# EAGLE schematic Chronos_DaughterBoard (EAGLE 9.7.0)
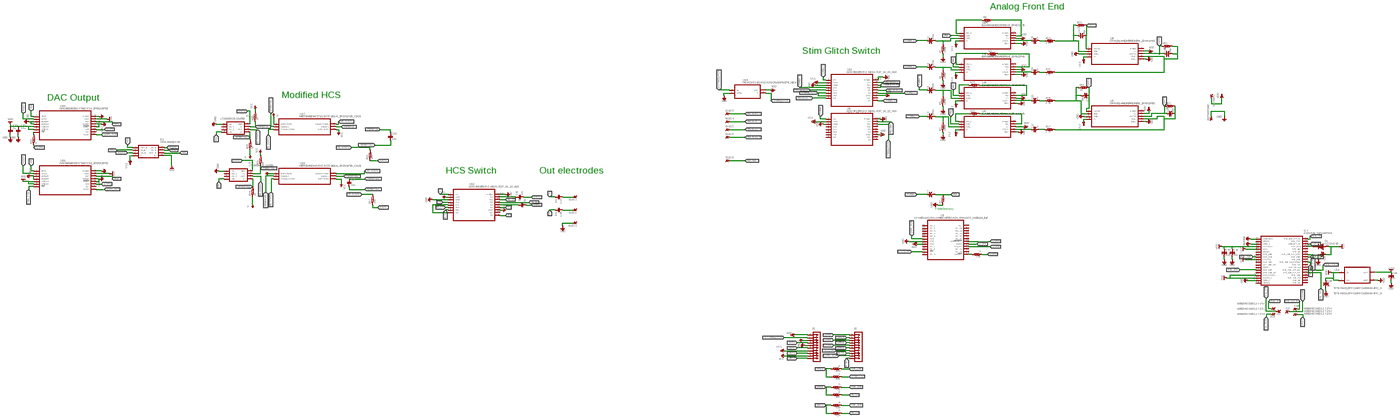
[diagram p0: schematic, sheet 1, overview]
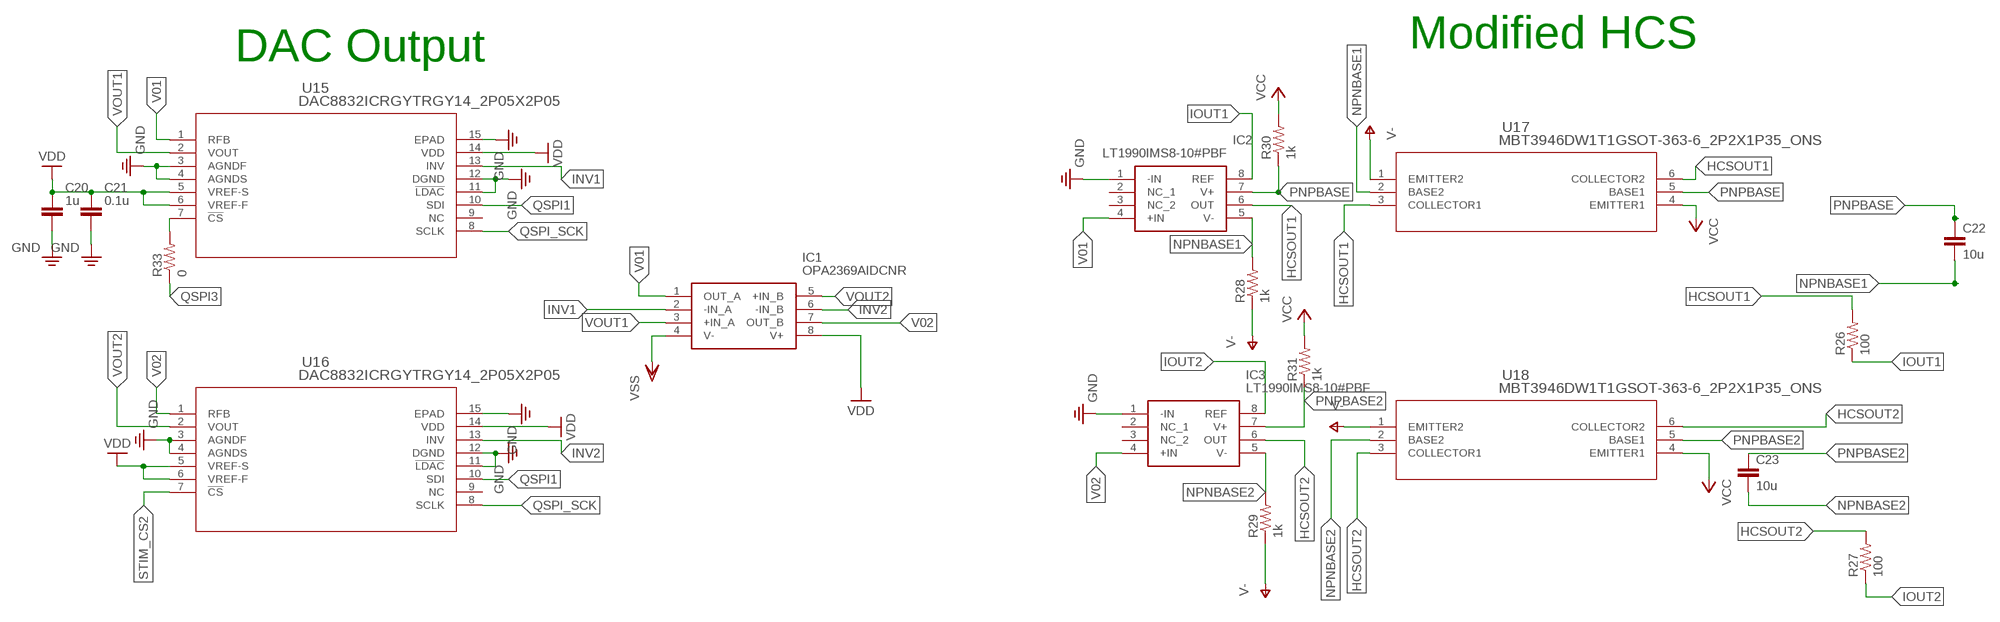
[diagram p1: schematic, sheet 1, part 1 of 4]
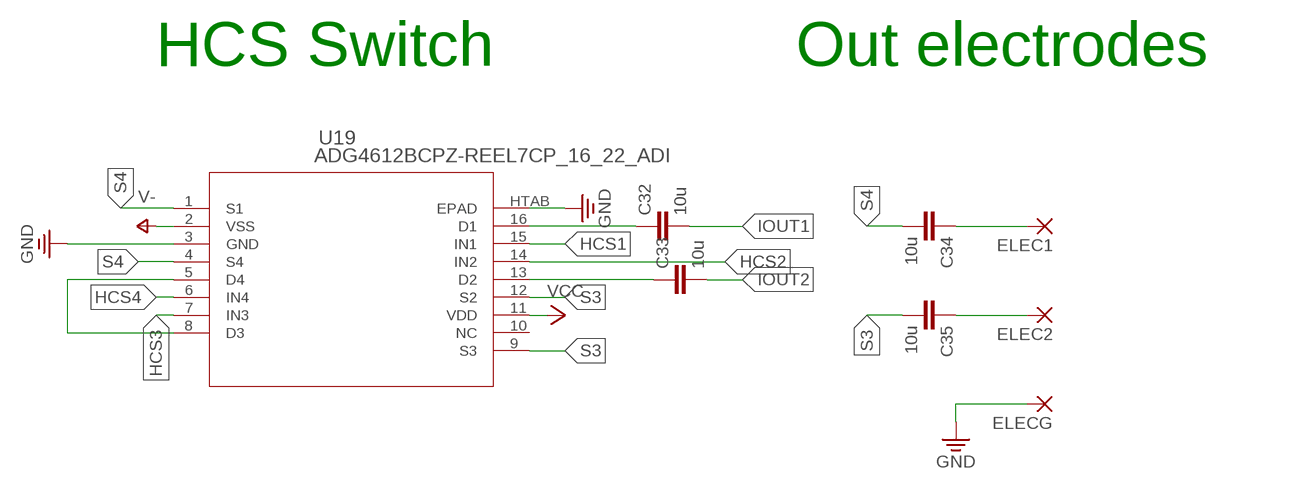
[diagram p2: schematic, sheet 1, part 2 of 4]
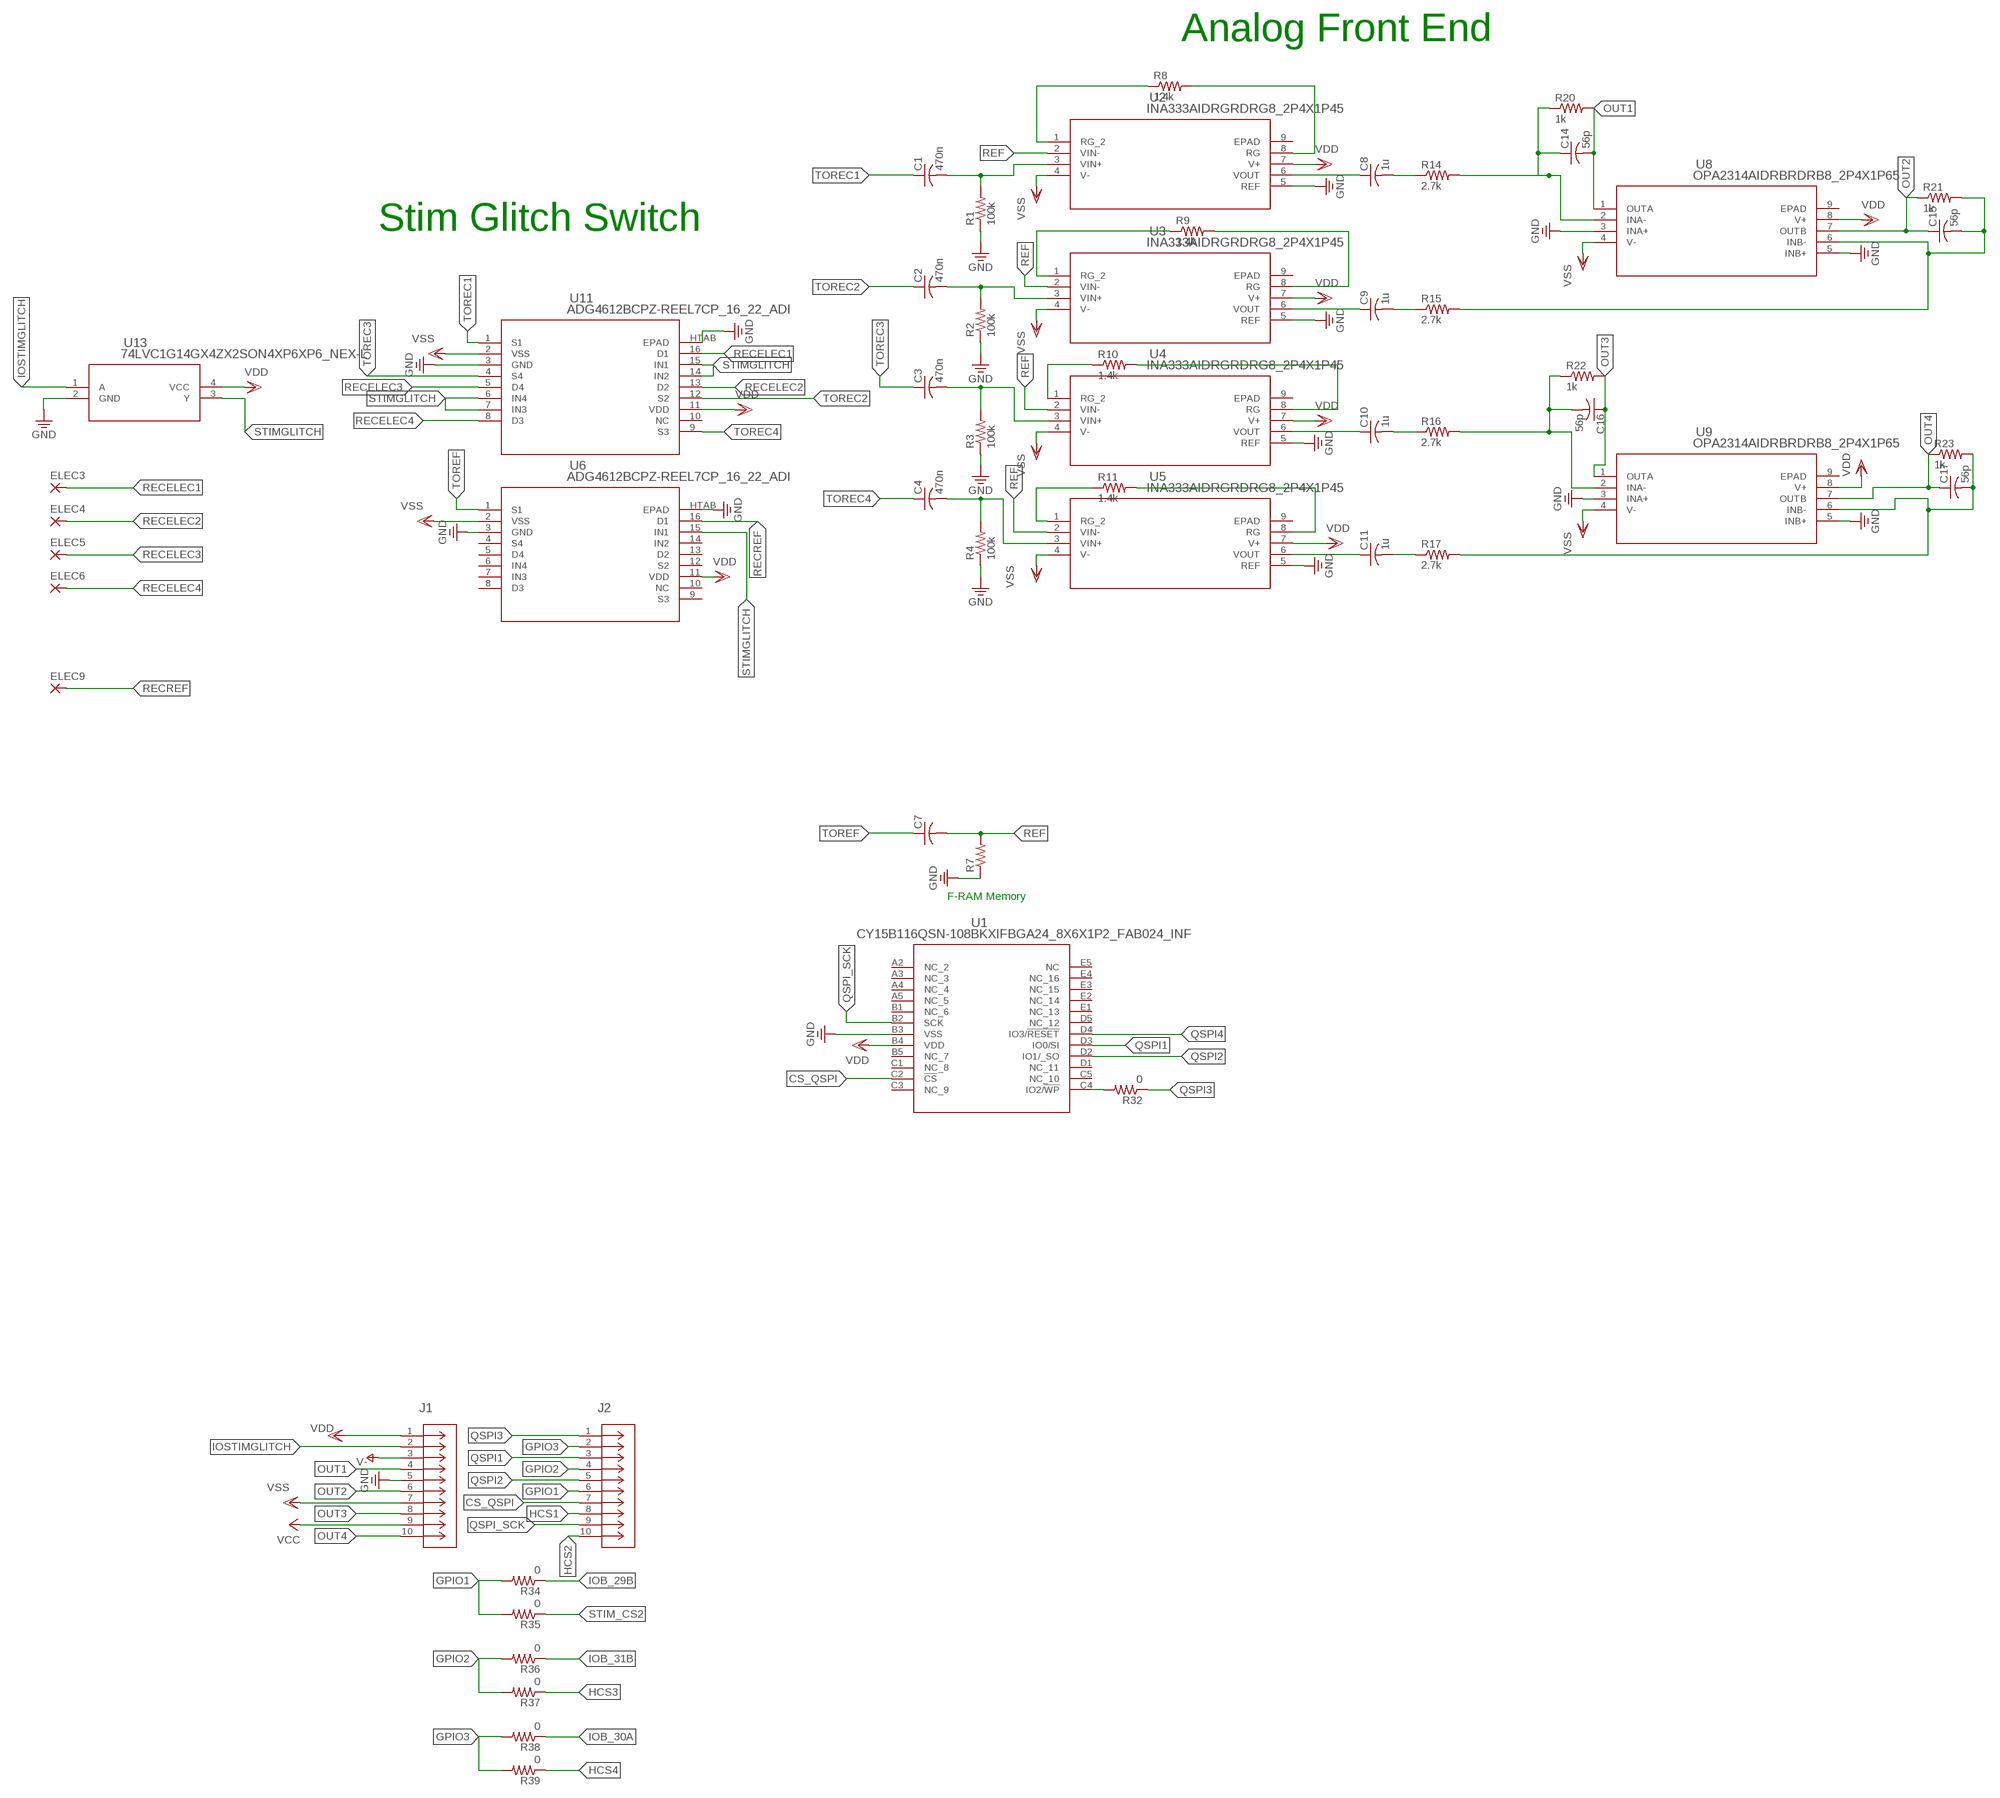
[diagram p3: schematic, sheet 1, part 3 of 4]
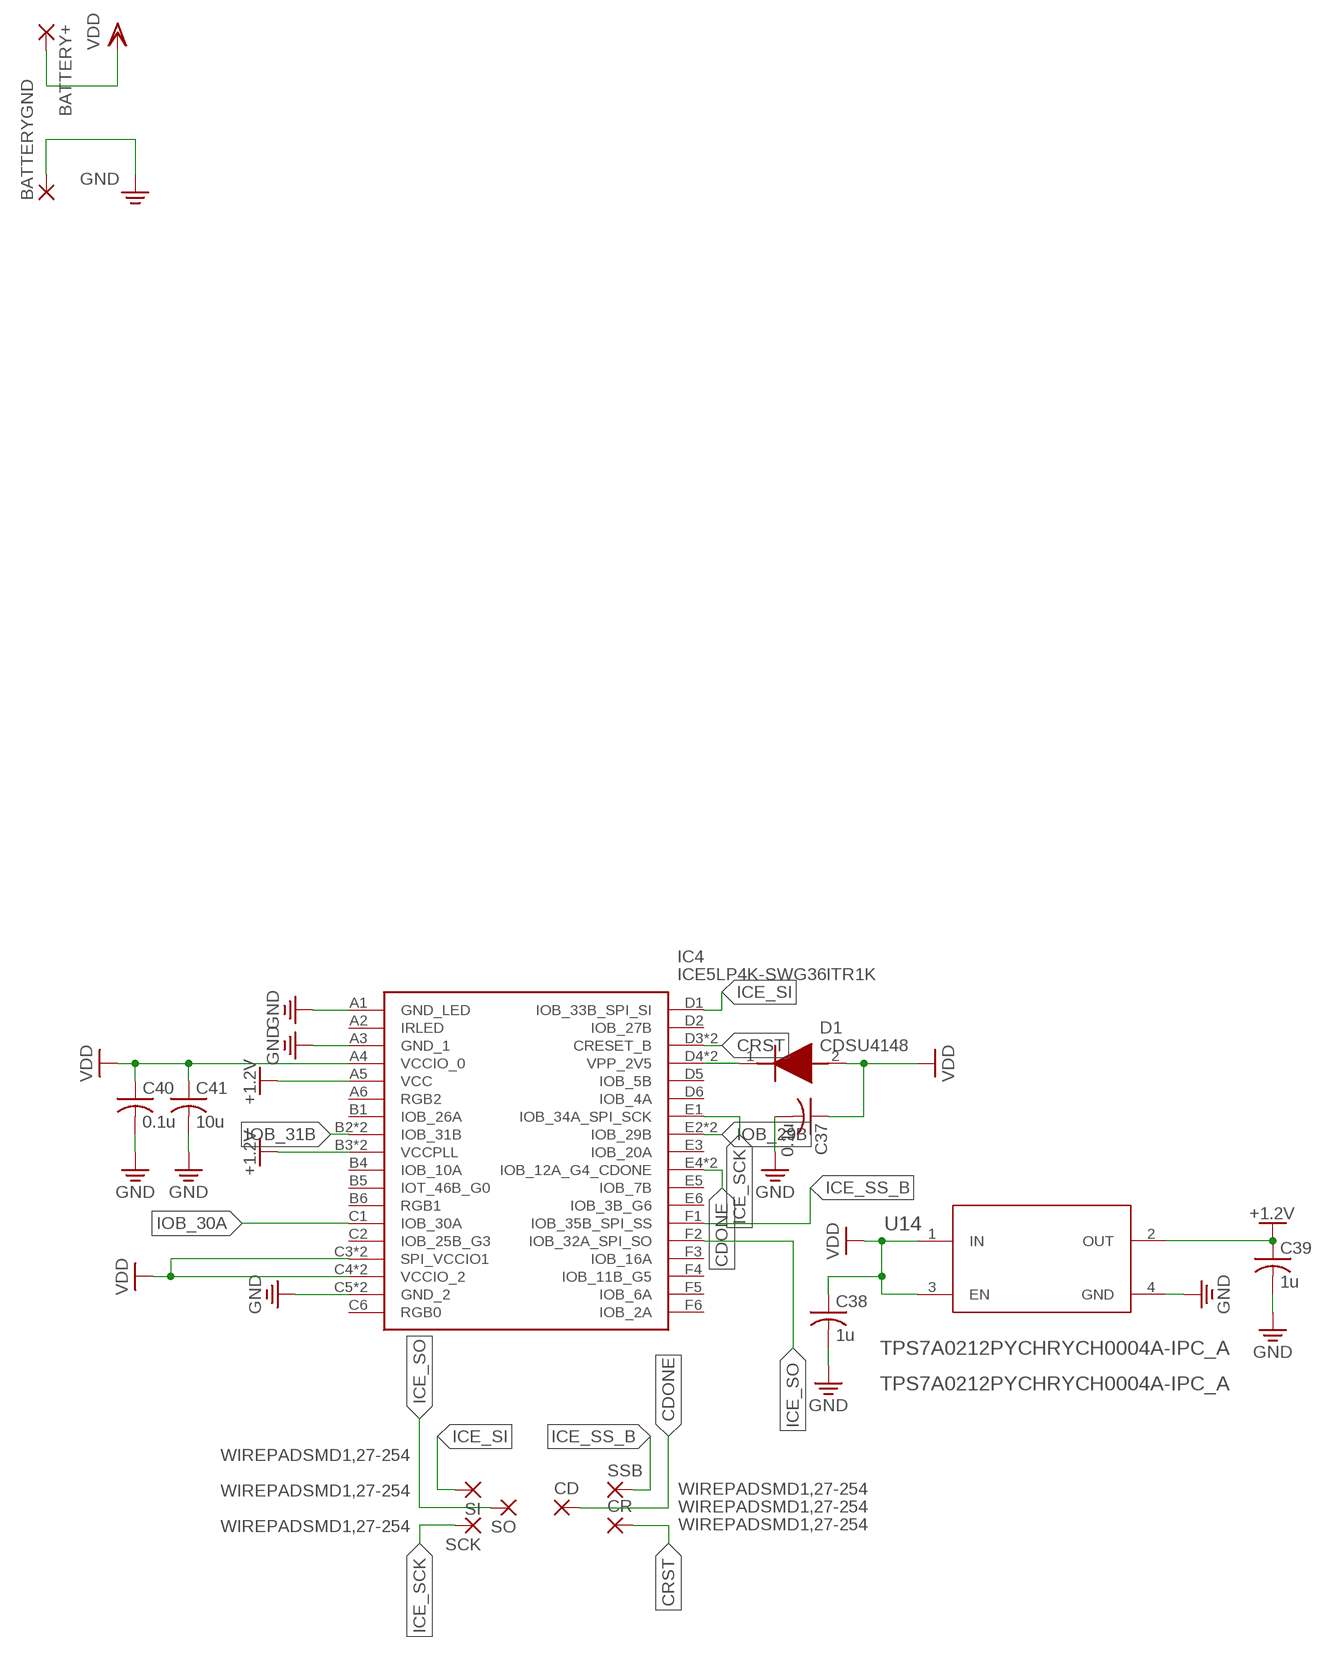
[diagram p4: schematic, sheet 1, part 4 of 4]

## Parts
BATTERY+  WIREPADSMD1,27-254  [SMD1,27-2,54]
BATTERYGND  WIREPADSMD1,27-254  [SMD1,27-2,54]
C1  470n  C-USC0201  [C0201]
C2  470n  C-USC0201  [C0201]
C3  470n  C-USC0201  [C0201]
C4  470n  C-USC0201  [C0201]
C7  C-USC0201  [C0201]
C8  1u  C-USC0201  [C0201]
C9  1u  C-USC0201  [C0201]
C10  1u  C-USC0201  [C0201]
C11  1u  C-USC0201  [C0201]
C14  56p  C-USC0201  [C0201]
C15  56p  C-USC0201  [C0201]
C16  56p  C-USC0201  [C0201]
C17  56p  C-USC0201  [C0201]
C20  1u  C_CHIP-0402(1005-METRIC)  [CAPC1005X60]
C21  0.1u  C_CHIP-0402(1005-METRIC)  [CAPC1005X60]
C22  10u  CAPACITOR_0201_L  [RESC0201_L]
C23  10u  CAPACITOR_0201_L  [RESC0201_L]
C32  10u  CAPACITOR_0201_L  [RESC0201_L]
C33  10u  CAPACITOR_0201_L  [RESC0201_L]
C34  10u  CAPACITOR_0201_L  [RESC0201_L]
C35  10u  CAPACITOR_0201_L  [RESC0201_L]
C37  0.1u  C-USC0201  [C0201]
C38  1u  C-USC0201  [C0201]
C39  1u  C-USC0201  [C0201]
C40  0.1u  C-USC0201  [C0201]
C41  10u  C-USC0201  [C0201]
CD  WIREPADSMD1,27-254  [SMD1,27-2,54]
CR  WIREPADSMD1,27-254  [SMD1,27-2,54]
D1  CDSU4148  [DIOM179X85N]
ELEC1  WIREPADSMD1,27-254  [SMD1,27-2,54]
ELEC2  WIREPADSMD1,27-254  [SMD1,27-2,54]
ELEC3  WIREPADSMD1,27-254  [SMD1,27-2,54]
ELEC4  WIREPADSMD1,27-254  [SMD1,27-2,54]
ELEC5  WIREPADSMD1,27-254  [SMD1,27-2,54]
ELEC6  WIREPADSMD1,27-254  [SMD1,27-2,54]
ELEC9  WIREPADSMD1,27-254  [SMD1,27-2,54]
ELECG  WIREPADSMD1,27-254  [SMD1,27-2,54]
IC1  OPA2369AIDCNR  [SOT65P280X145-8N]
IC2  LT1990IMS8-10#PBF  [SOP65P490X110-8N]
IC3  LT1990IMS8-10#PBF  [SOP65P490X110-8N]
IC4  ICE5LP4K-SWG36ITR1K  [BGA36C35P6X6_208X208X49]
J1  BM28B0.6-10DS/2-0.35V(51)CONN10_HIR  [CONN10_HIR]
J2  BM28B0.6-10DS/2-0.35V(51)CONN10_HIR  [CONN10_HIR]
R1  100k  R-US_R0201  [R0201]
R2  100k  R-US_R0201  [R0201]
R3  100k  R-US_R0201  [R0201]
R4  100k  R-US_R0201  [R0201]
R7  R-US_R0201  [R0201]
R8  1.4k  R-US_R0201  [R0201]
R9  1.4k  R-US_R0201  [R0201]
R10  1.4k  R-US_R0201  [R0201]
R11  1.4k  R-US_R0201  [R0201]
R14  2.7k  R-US_R0201  [R0201]
R15  2.7k  R-US_R0201  [R0201]
R16  2.7k  R-US_R0201  [R0201]
R17  2.7k  R-US_R0201  [R0201]
R20  1k  R-US_R0201  [R0201]
R21  1k  R-US_R0201  [R0201]
R22  1k  R-US_R0201  [R0201]
R23  1k  R-US_R0201  [R0201]
R26  100  R-US_R0201  [R0201]
R27  100  R-US_R0201  [R0201]
R28  1k  R-US_R0201  [R0201]
R29  1k  R-US_R0201  [R0201]
R30  1k  R-US_R0201  [R0201]
R31  1k  R-US_R0201  [R0201]
R32  0  R-US_R0201  [R0201]
R33  0  R-US_R0201  [R0201]
R34  0  R-US_R0201  [R0201]
R35  0  R-US_R0201  [R0201]
R36  0  R-US_R0201  [R0201]
R37  0  R-US_R0201  [R0201]
R38  0  R-US_R0201  [R0201]
R39  0  R-US_R0201  [R0201]
SCK  WIREPADSMD1,27-254  [SMD1,27-2,54]
SI  WIREPADSMD1,27-254  [SMD1,27-2,54]
SO  WIREPADSMD1,27-254  [SMD1,27-2,54]
SSB  WIREPADSMD1,27-254  [SMD1,27-2,54]
U1  CY15B116QSN-108BKXIFBGA24_8X6X1P2_FAB024_INF  [FBGA24_8X6X1P2_FAB024_INF]
U2  INA333AIDRGRDRG8_2P4X1P45  [DRG8_2P4X1P45]
U3  INA333AIDRGRDRG8_2P4X1P45  [DRG8_2P4X1P45]
U4  INA333AIDRGRDRG8_2P4X1P45  [DRG8_2P4X1P45]
U5  INA333AIDRGRDRG8_2P4X1P45  [DRG8_2P4X1P45]
U6  ADG4612BCPZ-REEL7CP_16_22_ADI  [CP_16_22_ADI]
U8  OPA2314AIDRBRDRB8_2P4X1P65  [DRB8_2P4X1P65]
U9  OPA2314AIDRBRDRB8_2P4X1P65  [DRB8_2P4X1P65]
U11  ADG4612BCPZ-REEL7CP_16_22_ADI  [CP_16_22_ADI]
U13  74LVC1G14GX4ZX2SON4XP6XP6_NEX-L  [X2SON4XP6XP6_NEX-L]
U14  TPS7A0212PYCHRYCH0004A-IPC_A  [YCH0004A-IPC_A]
U15  DAC8832ICRGYTRGY14_2P05X2P05  [RGY14_2P05X2P05]
U16  DAC8832ICRGYTRGY14_2P05X2P05  [RGY14_2P05X2P05]
U17  MBT3946DW1T1GSOT-363-6_2P2X1P35_ONS  [SOT-363-6_2P2X1P35_ONS]
U18  MBT3946DW1T1GSOT-363-6_2P2X1P35_ONS  [SOT-363-6_2P2X1P35_ONS]
U19  ADG4612BCPZ-REEL7CP_16_22_ADI  [CP_16_22_ADI]

## Nets
+1.2V: C39.1 IC4.A5(VCC) U14.2(OUT)
CDONE: CD.1(P) IC4.E4(IOB_12A_G4_CDONE) IC4.P$9(IOB_12A_G4_CDONE)
CRST: CR.1(P) IC4.D3(CRESET_B) IC4.P$6(CRESET_B)
CS_QSPI: J2.7 U1.C2(!CS)
GND: BATTERYGND.1(P) C20.2 C21.2 C37.2 C38.2 C39.2 C40.2 C41.2 ELECG.1(P) IC2.1(-IN) IC3.1(-IN) IC4.A1(GND_LED) IC4.A3(GND_1) IC4.C5(GND_2) IC4.P$5(GND_2) J1.5 R1.1 R2.1 R3.1 R4.1 R7.1 U1.B3(VSS) U2.5(REF) U3.5(REF) U4.5(REF) U5.5(REF) U6.3(GND) U6.HTAB(EPAD) U8.3(INA+) U8.5(INB+) U9.3(INA+) U9.5(INB+) U11.3(GND) U11.HTAB(EPAD) U13.2(GND) U14.4(GND) U15.3(AGNDF) U15.4(AGNDS) U15.11(!LDAC) U15.12(DGND) U15.15(EPAD) U16.3(AGNDF) U16.4(AGNDS) U16.11(!LDAC) U16.12(DGND) U16.15(EPAD) U19.3(GND) U19.HTAB(EPAD)
GPIO1: J2.6 R34.2 R35.2
GPIO2: J2.4 R36.2 R37.2
GPIO3: J2.2 R38.2 R39.2
HCS1: J2.8 U19.15(IN1)
HCS2: J2.10 U19.14(IN2)
HCS3: R37.1 U19.7(IN3)
HCS4: R39.1 U19.6(IN4)
HCSOUT1: IC2.6(OUT) R26.2 U17.3(COLLECTOR1) U17.6(COLLECTOR2)
HCSOUT2: IC3.6(OUT) R27.2 U18.3(COLLECTOR1) U18.6(COLLECTOR2)
ICE_SCK: IC4.E1(IOB_34A_SPI_SCK) SCK.1(P)
ICE_SI: IC4.D1(IOB_33B_SPI_SI) SI.1(P)
ICE_SO: IC4.F2(IOB_32A_SPI_SO) SO.1(P)
ICE_SS_B: IC4.F1(IOB_35B_SPI_SS) SSB.1(P)
INV1: IC1.2(-IN_A) U15.13(INV)
INV2: IC1.6(-IN_B) U16.13(INV)
IOB_29B: IC4.E2(IOB_29B) IC4.P$8(IOB_29B) R34.1
IOB_30A: IC4.C1(IOB_30A) R38.1
IOB_31B: IC4.B2(IOB_31B) IC4.P$1(IOB_31B) R36.1
IOSTIMGLITCH: J1.2 U13.1(A)
IOUT1: C32.2 IC2.8(REF) R26.1
IOUT2: C33.2 IC3.8(REF) R27.1
N$1: C1.2 R1.2 U2.3(VIN+)
N$2: R8.2 U2.8(RG)
N$3: IC4.B3(VCCPLL) IC4.P$2(VCCPLL) ; supply symbol labelled +1.2V
N$5: C4.2 R4.2 U5.3(VIN+)
N$6: C3.2 R3.2 U4.3(VIN+)
N$7: C2.2 R2.2 U3.3(VIN+)
N$8: R8.1 U2.1(RG_2)
N$9: R9.1 U3.1(RG_2)
N$10: R9.2 U3.8(RG)
N$11: R10.2 U4.8(RG)
N$12: R10.1 U4.1(RG_2)
N$13: R11.1 U5.1(RG_2)
N$14: R11.2 U5.8(RG)
N$19: C8.1 U2.6(VOUT)
N$20: C8.2 R14.1
N$21: C9.1 U3.6(VOUT)
N$22: C9.2 R15.1
N$23: C10.1 U4.6(VOUT)
N$24: C10.2 R16.1
N$25: C11.1 U5.6(VOUT)
N$26: C11.2 R17.1
N$31: C14.1 R14.2 R20.1 U8.2(INA-)
N$32: C15.2 R15.2 R21.2 U8.6(INB-)
N$33: C17.2 R17.2 R23.2 U9.6(INB-)
N$34: C16.2 R16.2 R22.1 U9.2(INA-)
N$37: D1.1(K) IC4.D4(VPP_2V5) IC4.P$7(VPP_2V5)
N$38: R32.2 U1.C4(IO2/!WP)
N$39: C32.1 U19.16(D1)
N$40: C33.1 U19.13(D2)
N$41: U19.5(D4) U19.8(D3)
N$42: C34.1 ELEC1.1(P)
N$43: C35.1 ELEC2.1(P)
N$44: R33.2 U15.7(!CS)
NPNBASE1: C22.2 IC2.5(V-) R28.2 U17.2(BASE2)
NPNBASE2: C23.2 IC3.5(V-) R29.2 U18.2(BASE2)
OUT1: C14.2 J1.4 R20.2 U8.1(OUTA)
OUT2: C15.1 J1.6 R21.1 U8.7(OUTB)
OUT3: C16.1 J1.8 R22.2 U9.1(OUTA)
OUT4: C17.1 J1.10 R23.1 U9.7(OUTB)
PNPBASE: C22.1 IC2.7(V+) R30.1 U17.5(BASE1)
PNPBASE2: C23.1 IC3.7(V+) R31.1 U18.5(BASE1)
QSPI1: J2.3 U1.D3(IO0/SI) U15.10(SDI) U16.10(SDI)
QSPI2: J2.5 U1.D2(IO1/_SO)
QSPI3: J2.1 R32.1 R33.1
QSPI4: U1.D4(IO3/!RESET)
QSPI_SCK: J2.9 U1.B2(SCK) U15.8(SCLK) U16.8(SCLK)
RECELEC1: ELEC3.1(P) U11.16(D1)
RECELEC2: ELEC4.1(P) U11.13(D2)
RECELEC3: ELEC5.1(P) U11.5(D4)
RECELEC4: ELEC6.1(P) U11.8(D3)
RECREF: ELEC9.1(P) U6.16(D1)
REF: C7.2 R7.2 U2.2(VIN-) U3.2(VIN-) U4.2(VIN-) U5.2(VIN-)
S3: C35.2 U19.9(S3) U19.12(S2)
S4: C34.2 U19.1(S1) U19.4(S4)
STIM_CS2: R35.1 U16.7(!CS)
STIMGLITCH: U6.15(IN1) U11.6(IN4) U11.7(IN3) U11.14(IN2) U11.15(IN1) U13.3(Y)
TOREC1: C1.1 U11.1(S1)
TOREC2: C2.1 U11.12(S2)
TOREC3: C3.1 U11.4(S4)
TOREC4: C4.1 U11.9(S3)
TOREF: C7.1 U6.1(S1)
V01: IC1.1(OUT_A) IC2.4(+IN) U15.1(RFB)
V02: IC1.7(OUT_B) IC3.4(+IN) U16.1(RFB)
V-: J1.3 R28.1 R29.1 U17.1(EMITTER2) U18.1(EMITTER2) U19.2(VSS)
VCC: J1.9 R30.2 R31.2 U17.4(EMITTER1) U18.4(EMITTER1) U19.11(VDD)
VDD: BATTERY+.1(P) C20.1 C21.1 C37.1 C38.1 C40.1 C41.1 D1.2(A) IC1.8(V+) IC4.A4(VCCIO_0) IC4.C3(SPI_VCCIO1) IC4.C4(VCCIO_2) IC4.P$3(SPI_VCCIO1) IC4.P$4(VCCIO_2) J1.1 U1.B4(VDD) U2.7(V+) U3.7(V+) U4.7(V+) U5.7(V+) U6.11(VDD) U8.8(V+) U9.8(V+) U11.11(VDD) U13.4(VCC) U14.1(IN) U14.3(EN) U15.5(VREF-S) U15.6(VREF-F) U15.14(VDD) U16.5(VREF-S) U16.6(VREF-F) U16.14(VDD)
VOUT1: IC1.3(+IN_A) U15.2(VOUT)
VOUT2: IC1.5(+IN_B) U16.2(VOUT)
VSS: IC1.4(V-) J1.7 U2.4(V-) U3.4(V-) U4.4(V-) U5.4(V-) U6.2(VSS) U8.4(V-) U9.4(V-) U11.2(VSS)
Unconnected: IC2.2(NC_1) IC2.3(NC_2) IC3.2(NC_1) IC3.3(NC_2) IC4.A2(IRLED) IC4.A6(RGB2) IC4.B1(IOB_26A) IC4.B4(IOB_10A) IC4.B5(IOT_46B_G0) IC4.B6(RGB1) IC4.C2(IOB_25B_G3) IC4.C6(RGB0) IC4.D2(IOB_27B) IC4.D5(IOB_5B) IC4.D6(IOB_4A) IC4.E3(IOB_20A) IC4.E5(IOB_7B) IC4.E6(IOB_3B_G6) IC4.F3(IOB_16A) IC4.F4(IOB_11B_G5) IC4.F5(IOB_6A) IC4.F6(IOB_2A) U1.A2(NC_2) U1.A3(NC_3) U1.A4(NC_4) U1.A5(NC_5) U1.B1(NC_6) U1.B5(NC_7) U1.C1(NC_8) U1.C3(NC_9) U1.C5(NC_10) U1.D1(NC_11) U1.D5(NC_12) U1.E1(NC_13) U1.E2(NC_14) U1.E3(NC_15) U1.E4(NC_16) U1.E5(NC) U2.9(EPAD) U3.9(EPAD) U4.9(EPAD) U5.9(EPAD) U6.4(S4) U6.5(D4) U6.6(IN4) U6.7(IN3) U6.8(D3) U6.9(S3) U6.10(NC) U6.12(S2) U6.13(D2) U6.14(IN2) U8.9(EPAD) U9.9(EPAD) U11.10(NC) U15.9(NC) U16.9(NC) U19.10(NC)

## Notes on the sheet
- Analog Front End
- Stim Glitch Switch
- DAC Output | Modified HCS
- HCS Switch | Out electrodes
- F-RAM Memory

## Library data of the parts
BATTERY+ BATTERYGND CD CR ELEC1-ELEC6 ELEC9 ELECG SCK SI SO SSB = wirepad:WIREPAD: Wire PAD connect wire on PCB
C1-C4 C7-C11 C14-C17 C37-C41 = rcl:C-US: CAPACITOR, American symbol; SPICEPREFIX: C
C20 C21 = ChronosV5 v10:C: Capacitor - Generic; CATEGORY: Capacitor
C22 C23 C32-C35 = ChronosV5 v10:CAPACITOR: Generic chip capacitor
D1 = CDSU4148:CDSU4148: COMCHIP TECHNOLOGY CDSU4148 Switching Diode, 150mA 75V, 2-Pin SOD-523F Source: Datasheet <https://datasheet.datasheetarchive.com/originals/distributors/Datasheets-7/DSA-139250.pdf>; DESCRIPTION: COMCHIP TECHNOLOGY CDSU4148 Switching Diode, 150mA 75V, 2-Pin SOD-523F; HEIGHT: 0.85mm; MANUFACTURER_NAME: Comchip Technology; MANUFACTURER_PART_NUMBER: CDSU4148; MOUSER_PART_NUMBER: 750-CDSU4148; MOUSER_PRICE-STOCK: https://www.mouser.co.uk/ProductDetail/Comchip-Technology/CDSU4148?qs=tw%252BuQ%2FB6PO1A4Pq3N4jPEA%3D%3D
IC1 = ChronosV5 v10:OPA2369AIDCNR: 1.8V, 700nA, Zero-Crossover Rail-To-Rail I/O Operational Amplifier Source: Datasheet <http://www.ti.com/lit/gpn/OPA2369>; DESCRIPTION: 1.8V, 700nA, Zero-Crossover Rail-To-Rail I/O Operational Amplifier; HEIGHT: 1.45mm; MANUFACTURER_NAME: Texas Instruments; MANUFACTURER_PART_NUMBER: OPA2369AIDCNR; MOUSER_PART_NUMBER: 595-OPA2369AIDCNR; MOUSER_PRICE-STOCK: https://www.mouser.co.uk/ProductDetail/Texas-Instruments/OPA2369AIDCNR?qs=ToK3%2FczOkx80MGOHG9Fs2Q%3D%3D
IC2 IC3 = LT1990IMS8-10#PBF:LT1990IMS8-10#PBF: SP Amp Difference Amplifier Single R-R O/P +/-18V/36V 8-Pin MSOP Tube Source: Datasheet <https://www.arrow.com/en/products/lt1990ims8-10pbf/analog-devices>; DESCRIPTION: SP Amp Difference Amplifier Single R-R O/P +/-18V/36V 8-Pin MSOP Tube; HEIGHT: 1.1mm; MANUFACTURER_NAME: Analog Devices; MANUFACTURER_PART_NUMBER: LT1990IMS8-10#PBF; MOUSER_PART_NUMBER: 584-LT1990IMS810PB; MOUSER_PRICE-STOCK: https://www.mouser.co.uk/ProductDetail/Analog-Devices/LT1990IMS8-10PBF?qs=%252BEew9%252B0nqrCQeKoCriE%2FkQ%3D%3D
IC4 = ICE5LP4K-SWG36ITR1K_Through:ICE5LP4K-SWG36ITR1K: FPGA - Field Programmable Gate Array iCE40 Ultra FPGA 3520 Logic Cells Source: Datasheet <https://datasheet.datasheetarchive.com/originals/dk/DKDS-14/263178.pdf>; DESCRIPTION: FPGA - Field Programmable Gate Array iCE40 Ultra FPGA 3520 Logic Cells; HEIGHT: 0.491mm; MANUFACTURER_NAME: Lattice Semiconductor; MANUFACTURER_PART_NUMBER: ICE5LP4K-SWG36ITR1K; MOUSER_PART_NUMBER: 842-E5LP4KSWG36ITR1K; MOUSER_PRICE-STOCK: https://www.mouser.co.uk/ProductDetail/Lattice/ICE5LP4K-SWG36ITR1K?qs=rRTa3HiPCWNWvpq6B0HDxQ%3D%3D
J1 J2 = 2025-03-29_02-33-03_Library:BM28B0.6-10DS/2-0.35V(51); COPYRIGHT: Copyright (C) 2025 Ultra Librarian. All rights reserved.; MANUFACTURER_PART_NUMBER: BM28B0.6-10DS/2-0.35V(51); MFR_NAME: Hirose
R1-R4 R7-R11 R14-R17 R20-R23 R26-R39 = rcl:R-US_: RESISTOR, American symbol; SPICEPREFIX: R
U1 = 2025-03-20_21-36-23_Library:CY15B116QSN-108BKXI; COPYRIGHT: Copyright (C) 2025 Ultra Librarian. All rights reserved.; MANUFACTURER_PART_NUMBER: CY15B116QSN-108BKXI; MFR_NAME: Infineon; TYPE: Memory
U2-U5 = 2024-12-16_18-12-00_Library:INA333AIDRGR; COPYRIGHT: Copyright (C) 2024 Ultra Librarian. All rights reserved.; MANUFACTURER_PART_NUMBER: INA333AIDRGR; MFR_NAME: Texas Instruments
U6 U11 U19 = 2025-02-17_21-06-06_Library:ADG4612BCPZ-REEL7; COPYRIGHT: Copyright (C) 2025 Ultra Librarian. All rights reserved.; MANUFACTURER_PART_NUMBER: ADG4612BCPZ-REEL7; MFR_NAME: Analog Devices Inc
U8 U9 = 2025-03-21_02-11-42_Library:OPA2314AIDRBR; COPYRIGHT: Copyright (C) 2025 Ultra Librarian. All rights reserved.; MANUFACTURER_PART_NUMBER: OPA2314AIDRBR; MFR_NAME: Texas Instruments
U13 = 2024-11-12_21-13-53_Library:74LVC1G14GX4Z; COPYRIGHT: Copyright (C) 2024 Ultra Librarian. All rights reserved.; MANUFACTURER_PART_NUMBER: 74LVC1G14GX4Z; MFR_NAME: Nexperia
U14 = 2025-03-24_18-47-34_Library:TPS7A0212PYCHR; COPYRIGHT: Copyright (C) 2025 Ultra Librarian. All rights reserved.; MANUFACTURER_PART_NUMBER: TPS7A0212PYCHR; MFR_NAME: Texas Instruments; REFDES: RefDes; TYPE: TYPE
U15 U16 = 2024-10-29_22-15-03_Library:DAC8832ICRGYT; COPYRIGHT: Copyright (C) 2024 Ultra Librarian. All rights reserved.; MANUFACTURER_PART_NUMBER: DAC8832ICRGYT; MFR_NAME: Texas Instruments
U17 U18 = ChronosV5 v10:MBT3946DW1T1G; COPYRIGHT: Copyright (C) 2024 Ultra Librarian. All rights reserved.; MANUFACTURER_PART_NUMBER: MBT3946DW1T1G; MFR_NAME: onsemi